# Altium schematic sheet UART_INTERFACE.SchDoc
size A4; SheetNumber: 9; SheetTotal: 20
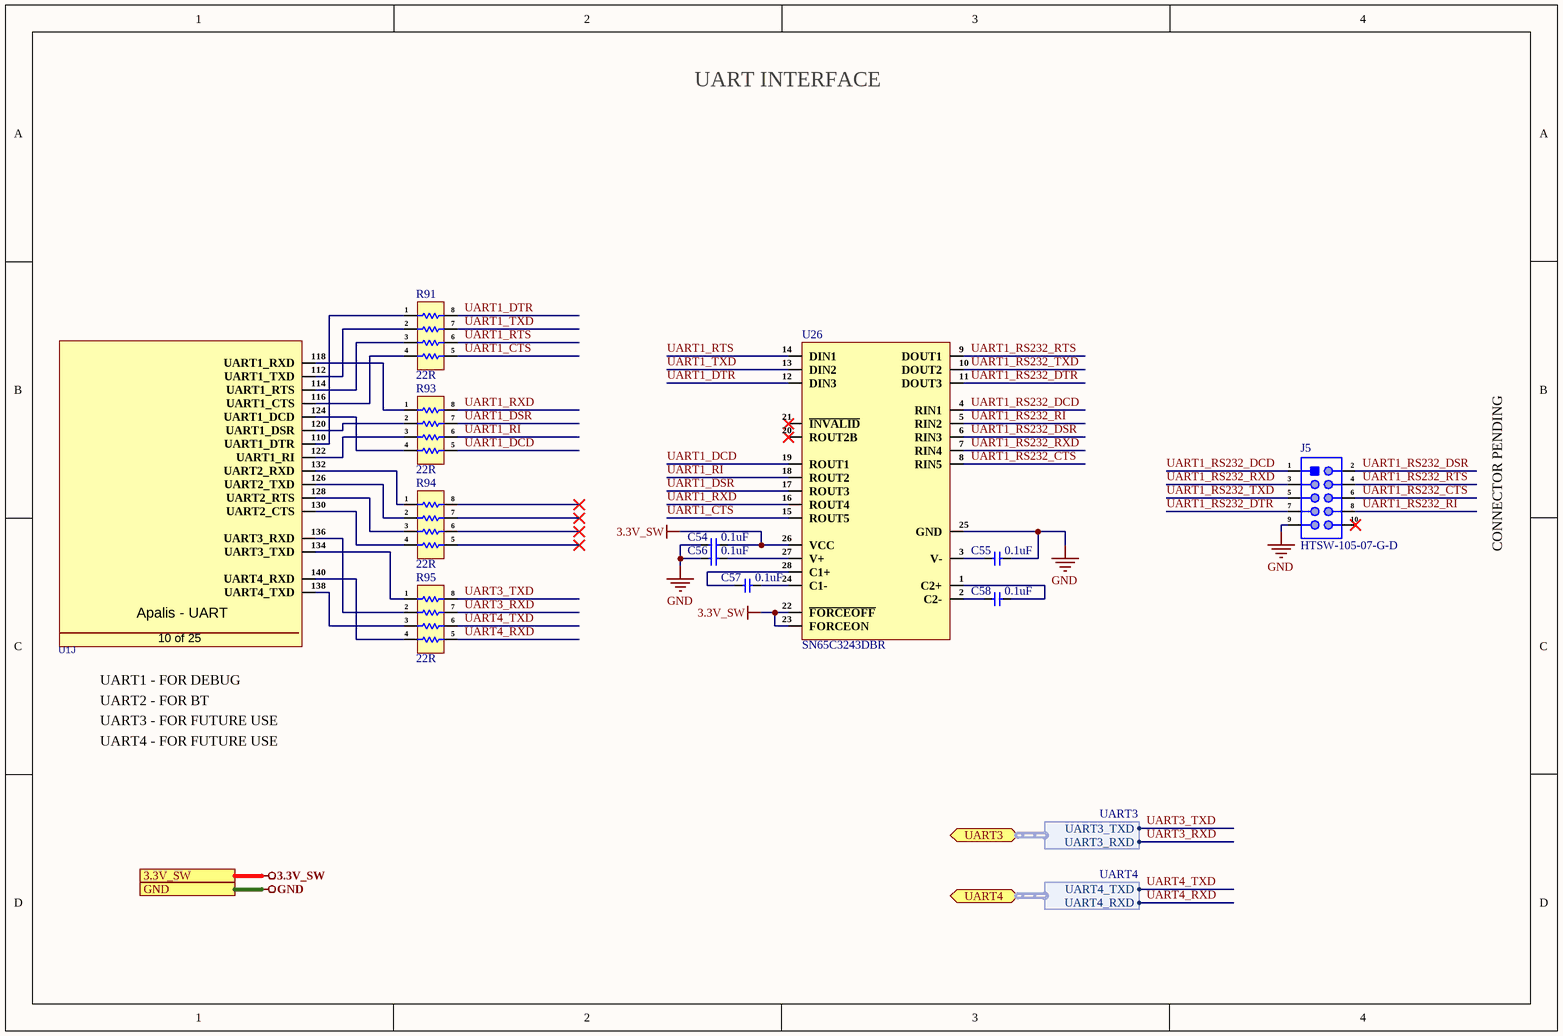
[diagram p0: UART_INTERFACE.SchDoc]

## Parts
C54  0.1uF  [Cap-0402]
C55  0.1uF  [Cap-0402]
C56  0.1uF  [Cap-0402]
C57  0.1uF  [Cap-0402]
C58  0.1uF  [Cap-0402]
J5  HTSW-105-07-G-D  [HTSW-105-07-G-D]
R91  22R  [YC164-JR-0722RL]
R93  22R  [YC164-JR-0722RL]
R94  22R  [YC164-JR-0722RL]
R95  22R  [YC164-JR-0722RL]
U1  MM70-314B1-2-R300  [MM70-314B1-2-R300]  (value not drawn)  (part J of 25)
U26  SN65C3243DBR  [SSOP-28-208mil]

## Ports
3.3V_SW (see Top_Sheet[1D], DIGITAL_I-O_O-P[1D], ETHERNET_INTERFACE[1D], FUTURE_USE_CONNECTOR[1D], HDMI_INTERFACE[1D], I2C_INTERFACE[1B], MICRO_SD_CARD_INTERFACE[1D]), GND (see Top_Sheet[1D], 03-CAN2_SPI_CAN_CONTROLLER[1D], APALIS_POWER_SUPPLY[1D], CAN2_SPI_CAN_CONTROLLER[1D], CODEC_INTERFACE[1D], CONNECTORS[1D], DC_DC_CONVERTER[1D], DIGITAL_I-O_O-P[1D], ETHERNET_INTERFACE[1D], FUTURE_USE_CONNECTOR[1D], GPIO_NC_INTERFACE[4B], HDMI_INTERFACE[1D], I2C_INTERFACE[1B], INPUT_SUPPLY_PROTECTION[1D], LTE_MODULE[1D], MECHANICAL_FOR_PCB[1D], MICRO_SD_CARD_INTERFACE[1D], Reset_and_SDIO[1D], USB3.0_INTERFACE[1D]), UART3 (bidir, harness UART3, see Top_Sheet[1D], FUTURE_USE_CONNECTOR[2D]), UART4 (bidir, harness UART4, see Top_Sheet[1D], FUTURE_USE_CONNECTOR[2D])

## Harnesses
UART3: UART3_TXD, UART3_RXD
UART4: UART4_TXD, UART4_RXD

## Nets
3.3V_SW: C54.2 U26.22(~{FORCEOFF}) U26.23(FORCEON) U26.26(VCC) ; port 3.3V_SW
GND: C54.1 C55.2 C56.1 J5.9 U26.25(GND) ; port GND
UART1_CTS: R91.5 U26.15(ROUT5)
UART1_DCD: R93.5 U26.19(ROUT1)
UART1_DSR: R93.7 U26.17(ROUT3)
UART1_DTR: R91.8 U26.12(DIN3)
UART1_RI: R93.6 U26.18(ROUT2)
UART1_RS232_CTS: J5.6 U26.8(RIN5)
UART1_RS232_DCD: J5.1 U26.4(RIN1)
UART1_RS232_DSR: J5.2 U26.6(RIN3)
UART1_RS232_DTR: J5.7 U26.11(DOUT3)
UART1_RS232_RI: J5.8 U26.5(RIN2)
UART1_RS232_RTS: J5.4 U26.9(DOUT1)
UART1_RS232_RXD: J5.3 U26.7(RIN4)
UART1_RS232_TXD: J5.5 U26.10(DOUT2)
UART1_RTS: R91.6 U26.14(DIN1)
UART1_RXD: R93.8 U26.16(ROUT4)
UART1_TXD: R91.7 U26.13(DIN2)
UART3_RXD: R95.7 ; port UART3.UART3_RXD
UART3_TXD: R95.8 ; port UART3.UART3_TXD
UART4_RXD: R95.5 ; port UART4.UART4_RXD
UART4_TXD: R95.6 ; port UART4.UART4_TXD
NetC55_1: C55.1 U26.3(V-)
NetC56_2: C56.2 U26.27(V+)
NetC57_1: C57.1 U26.28(C1+)
NetC57_2: C57.2 U26.24(C1-)
NetC58_1: C58.1 U26.2(C2-)
NetC58_2: C58.2 U26.1(C2+)
NetR91_1: R91.1 U1.110(UART1_DTR)
NetR91_2: R91.2 U1.112(UART1_TXD)
NetR91_3: R91.3 U1.114(UART1_RTS)
NetR91_4: R91.4 U1.116(UART1_CTS)
NetR93_1: R93.1 U1.118(UART1_RXD)
NetR93_2: R93.2 U1.120(UART1_DSR)
NetR93_3: R93.3 U1.122(UART1_RI)
NetR93_4: R93.4 U1.124(UART1_DCD)
NetR94_1: R94.1 U1.132(UART2_RXD)
NetR94_2: R94.2 U1.126(UART2_TXD)
NetR94_3: R94.3 U1.128(UART2_RTS)
NetR94_4: R94.4 U1.130(UART2_CTS)
NetR95_1: R95.1 U1.134(UART3_TXD)
NetR95_2: R95.2 U1.136(UART3_RXD)
NetR95_3: R95.3 U1.138(UART4_TXD)
NetR95_4: R95.4 U1.140(UART4_RXD)

Not connected (* = marked no-connect by the designer): J5 10*; R94 5* 6* 7* 8*; U26 20(ROUT2B)* 21(~{INVALID})*

## Notes on the sheet
- UART INTERFACE
- CONNECTOR PENDING
- UART1 - FOR DEBUG
- UART2 - FOR BT
- UART3 - FOR FUTURE USE
- UART4 - FOR FUTURE USE
- (in symbol MM70-314B1-2-R300, part J) Apalis - UART; 10 of 25

## Library data of the parts
C54-C58 = C0402C104K4REC7867: Cap Cer 0402 0.1UF 16V X7R 10%; Manufacturer: KEMET; Item Type: Capacitor; Supplier: Digi-Key; Supplier Part Number: 399-C0402C104K4REC7867CT-ND; Manufacturer Part Number: C0402C104K4REC7867; RoHS: No; Category: Ceramic Capacitors; Stock: 10918; Pricing: 1=0.1, 10=0.072, 50=0.0408, 100=0.0338, 500=0.02372, 1000=0.01963, 2500=0.01827, 5000=0.01672 (USD)
J5 = HTSW-105-07-G-D: CONN HEADER VERT 10POS 2.54MM; Manufacturer: Samtec; Supplier: Rs; Supplier Part Number: 1592350; Manufacturer Part Number: HTSW-105-07-G-D; RoHS: Yes; Category: Connectors; Stock: 16; Pricing: 1=1.3, 25=1.16, 50=1.09, 100=1, 500=0.81 (GBP); ComponentLink1URL: https://datasheet.ciiva.com/737/htsw-xxx-xx-xxx-x-xx-xx-xx-mkt-737898.pdf?src-supplier=Digi-Key; ComponentLink1Description: https://datasheet.ciiva.com/737/htsw-xxx-xx-xxx-x-xx-xx-xx-mkt-737898.pdf?src-supplier=Digi-Key; ComponentLink2URL: https://datasheet.ciiva.com/15195/getdatasheetpartid-252145-15195445.pdf?src-supplier=Verical; ComponentLink2Description: https://datasheet.ciiva.com/15195/getdatasheetpartid-252145-15195445.pdf?src-supplier=Verical
R91 R93-R95 = YC164-JR-0722RL: RES ARRAY 4 RES 22 OHM 1206; Manufacturer: Yageo; Supplier: Future Electronics; Supplier Part Number: 4472155; Manufacturer Part Number: YC164-JR-0722RL; RoHS: Yes; Category: Resistor Arrays; Stock: 225000; Pricing: 5000=0.0084, 20000=0.008, 50000=0.0078, 125000=0.0075, 200000=0.0071 (USD); ComponentLink1URL: https://datasheet.ciiva.com/8018/443424-8018007.pdf?src-supplier=Element14; ComponentLink1Description: https://datasheet.ciiva.com/8018/443424-8018007.pdf?src-supplier=Element14; ComponentLink2URL: https://datasheet.ciiva.com/8018/443424-8018008.pdf?src-supplier=Element14; ComponentLink2Description: https://datasheet.ciiva.com/8018/443424-8018008.pdf?src-supplier=Element14; ComponentLink3URL: https://datasheet.ciiva.com/2688/pyu-yc-tc164-51-rohs-l-3-2688422.pdf?src-supplier=Digi-Key; ComponentLink3Description: https://datasheet.ciiva.com/2688/pyu-yc-tc164-51-rohs-l-3-2688422.pdf?src-supplier=Digi-Key; ComponentLink4URL: https://datasheet.ciiva.com/2688/pyu-yc-tc164-51-rohs-l-3-2688421.pdf?src-supplier=Digi-Key; ComponentLink4Description: https://datasheet.ciiva.com/2688/pyu-yc-tc164-51-rohs-l-3-2688421.pdf?src-supplier=Digi-Key; ComponentLink5URL: https://datasheet.ciiva.com/8320/pyu-yc-tc164-51-rohs-l-3-8320230.pdf?src-supplier=Avnet; ComponentLink5Description: https://datasheet.ciiva.com/8320/pyu-yc-tc164-51-rohs-l-3-8320230.pdf?src-supplier=Avnet; ComponentLink6URL: https://datasheet.ciiva.com/2688/pyu-yc-tc164-51-rohs-l-3-2688423.pdf?src-supplier=Digi-Key; ComponentLink6Description: https://datasheet.ciiva.com/2688/pyu-yc-tc164-51-rohs-l-3-2688423.pdf?src-supplier=Digi-Key; ComponentLink7URL: https://datasheet.ciiva.com/17030/pyu-yc-tc164-51-rohs-l-3-17030158.pdf?src-supplier=Future+Electronics; ComponentLink7Description: https://datasheet.ciiva.com/17030/pyu-yc-tc164-51-rohs-l-3-17030158.pdf?src-supplier=Future+Electronics; ComponentLink8URL: https://datasheet.ciiva.com/28379/pyu-yc-tc164-51-rohs-l-3-28379358.pdf?; ComponentLink8Description: https://datasheet.ciiva.com/28379/pyu-yc-tc164-51-rohs-l-3-28379358.pdf?
U1 = MM70-314B1-2-R300: CONN MXM 3.0 FMALE 314POS 0.020; Manufacturer: JAE Electronics; Supplier: Digi-Key; Supplier Part Number: 670-MM70-314B1-2-R300CT-ND; Manufacturer Part Number: MM70-314B1-2-R300; RoHS: No; Category: Card Edge Connectors; Stock: 4979; Pricing: 1=9.21, 10=8.287, 25=7.8064, 50=7.6064, 100=7.4062 (USD)
U26 = SN65C3243DBR: RCLAMP Series 16 Vcl 0.4 pF RailClamp® TVS Diode Array - SLP-1616P6; Manufacturer: Texas Instruments; Direction: Unidirectional; Value: 0.4pF; Number of Channels: 4; Number of Elements: 1; Reverse Standoff Voltage: 3.3V; Min Breakdown Voltage: 3.5V; Clamping Voltage: 16V; Peak Pulse Power: 80W; Power Line Protection: Yes; Leakage Current: 500nA; Peak Pulse Current: 5A; Supplier: Mouser; Supplier Part Number: 595-SN65C3243DBR; Manufacturer Part Number: SN65C3243DBR; RoHS: Yes; Category: Interface ICs; Stock: 5977; Pricing: 1=3.6, 10=3.17, 50=3.17, 100=2.65, 1000=1.9, 10000=1.71 (USD); ComponentLink1URL: https://datasheet.ciiva.com/41461/001186900-da-01-en-ic-line-drvr-rc-sn65c3243dbr-ssop-28-tid-41461426.pdf?src-supplier=Conrad; ComponentLink1Description: https://datasheet.ciiva.com/41461/001186900-da-01-en-ic-line-drvr-rc-sn65c3243dbr-ssop-28-tid-41461426.pdf?src-supplier=Conrad; ComponentLink2URL: https://datasheet.ciiva.com/15151/getdatasheetpartid-129898-15151437.pdf?src-supplier=Verical; ComponentLink2Description: https://datasheet.ciiva.com/15151/getdatasheetpartid-129898-15151437.pdf?src-supplier=Verical; ComponentLink3URL: https://datasheet.ciiva.com/1704/sn65c3243-1704841.pdf?src-supplier=Digi-Key; ComponentLink3Description: https://datasheet.ciiva.com/1704/sn65c3243-1704841.pdf?src-supplier=Digi-Key; ComponentLink4URL: https://datasheet.ciiva.com/1704/sn65c3243-1704842.pdf?src-supplier=Digi-Key; ComponentLink4Description: https://datasheet.ciiva.com/1704/sn65c3243-1704842.pdf?src-supplier=Digi-Key; ComponentLink5URL: https://datasheet.ciiva.com/1704/sn65c3243-1704843.pdf?src-supplier=Digi-Key; ComponentLink5Description: https://datasheet.ciiva.com/1704/sn65c3243-1704843.pdf?src-supplier=Digi-Key; Mounting Technology: Surface Mount; Case/Package: QFN; Pins: 6; Min Operating Temperature: -55°C; Max Operating Temperature: 125°C; Packaging: Tape and Reel; Working Voltage: 3.3V; Polarity: Unidirectional; Operating Supply Voltage: 3.3V; Series: RailClamp®; Clamping Voltage-Max: 16V; Number of Unidirectional Channels: 4; Length: 1.6mm; Depth: 1.6mm; Radiation Hardening: No; Lead Free: Lead Free; RoHS Compliant: Yes; ComponentLink6URL: https://datasheet.ciiva.com/16480/rclamp2504p-tct-16480613.pdf?src-supplier=Future+Electronics; ComponentLink6Description: https://datasheet.ciiva.com/16480/rclamp2504p-tct-16480613.pdf?src-supplier=Future+Electronics; ComponentLink7URL: https://datasheet.ciiva.com/18065/getdatasheetpartid-146086-18065702.pdf?src-supplier=Verical; ComponentLink7Description: https://datasheet.ciiva.com/18065/getdatasheetpartid-146086-18065702.pdf?src-supplier=Verical; ComponentLink8URL: https://datasheet.ciiva.com/338/rclamp2504p-rclamp3304p-338729.pdf?src-supplier=Digi-Key; ComponentLink8Description: https://datasheet.ciiva.com/338/rclamp2504p-rclamp3304p-338729.pdf?src-supplier=Digi-Key; ComponentLink9URL: https://datasheet.ciiva.com/338/rclamp2504p-rclamp3304p-338730.pdf?src-supplier=Digi-Key; ComponentLink9Description: https://datasheet.ciiva.com/338/rclamp2504p-rclamp3304p-338730.pdf?src-supplier=Digi-Key; ComponentLink10URL: https://datasheet.ciiva.com/338/rclamp2504p-rclamp3304p-338728.pdf?src-supplier=Digi-Key; ComponentLink10Description: https://datasheet.ciiva.com/338/rclamp2504p-rclamp3304p-338728.pdf?src-supplier=Digi-Key; ComponentLink11URL: https://datasheet.ciiva.com/11193/rclamp2504p-rclamp3304p-11193626.pdf?src-supplier=Avnet; ComponentLink11Description: https://datasheet.ciiva.com/11193/rclamp2504p-rclamp3304p-11193626.pdf?src-supplier=Avnet